# Altium project Business_Idea_PCB.PrjPcb
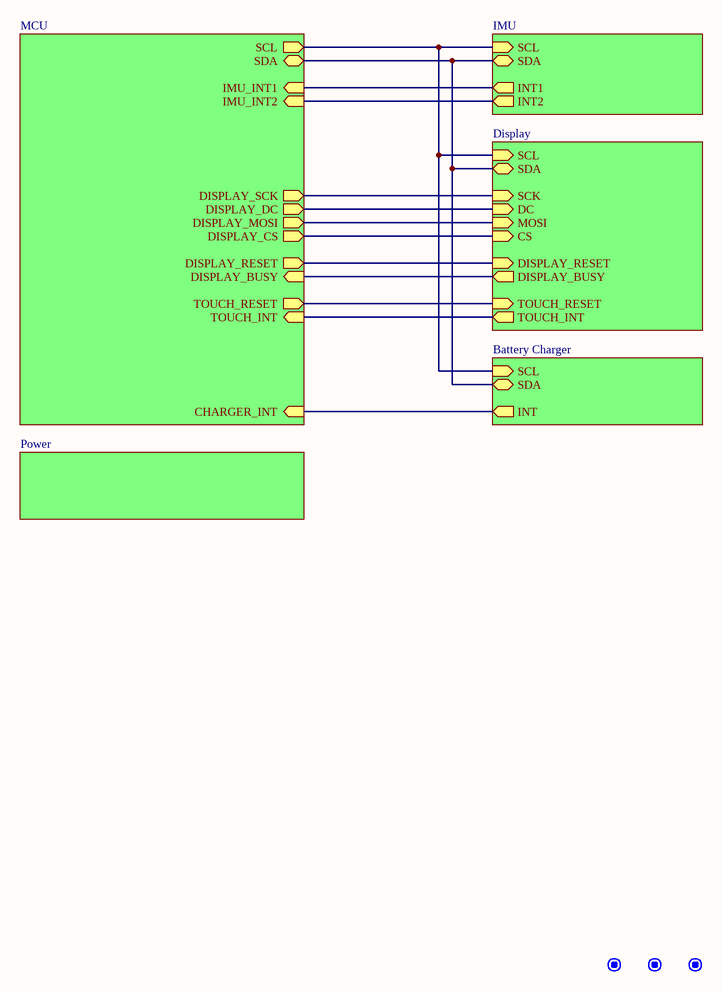
[diagram p0: Root.SchDoc]
ProjectTitle: Business Idea PCB
6 sheets, 51 parts. Net scope: hierarchical (ports join the sheet entries above them; power ports are global).
Board file: Business_Idea_PCB.PcbDoc
Sheets:
  Root.SchDoc
    MCU = MCU.SchDoc
    IMU = IMU.SchDoc
    Display = Display.SchDoc
    Battery Charger = Battery_Charger.SchDoc
    Power = Power.SchDoc

## Sheet Root.SchDoc: Business Idea PCB Root
size Tabloid; Author: Adam Turaj; SheetNumber: 1; SheetTotal: 6

### Parts
FD1  FID1X2R  [FID1X2R]  (value not drawn)  (no BOM)
FD2  FID1X2R  [FID1X2R]  (value not drawn)  (no BOM)
FD3  FID1X2R  [FID1X2R]  (value not drawn)  (no BOM)

### Sub-sheets
Battery Charger = Battery_Charger.SchDoc: SDA (bidir), SCL (in), INT (out)
Display = Display.SchDoc: SCL (in), SDA (bidir), SCK (in), DC (in), CS (in), MOSI (in), DISPLAY_BUSY (out), DISPLAY_RESET (in), TOUCH_INT (out), TOUCH_RESET (in)
IMU = IMU.SchDoc: INT2 (out), INT1 (out), SDA (bidir), SCL (in)
MCU = MCU.SchDoc: SCL (out), SDA (bidir), IMU_INT2 (in), IMU_INT1 (in), CHARGER_INT (in), TOUCH_INT (in), TOUCH_RESET (out), DISPLAY_BUSY (in), DISPLAY_RESET (out), DISPLAY_CS (out), DISPLAY_MOSI (out), DISPLAY_DC (out), DISPLAY_SCK (out)
Power = Power.SchDoc: no entries

### Nets
CHARGER_INT: sheet MCU/CHARGER_INT, sheet Battery Charger/INT
DISPLAY_BUSY: sheet MCU/DISPLAY_BUSY, sheet Display/DISPLAY_BUSY
DISPLAY_CS: sheet MCU/DISPLAY_CS, sheet Display/CS
DISPLAY_DC: sheet MCU/DISPLAY_DC, sheet Display/DC
DISPLAY_MOSI: sheet MCU/DISPLAY_MOSI, sheet Display/MOSI
DISPLAY_RESET: sheet MCU/DISPLAY_RESET, sheet Display/DISPLAY_RESET
DISPLAY_SCK: sheet MCU/DISPLAY_SCK, sheet Display/SCK
IMU_INT1: sheet MCU/IMU_INT1, sheet IMU/INT1
IMU_INT2: sheet MCU/IMU_INT2, sheet IMU/INT2
SCL: sheet MCU/SCL, sheet IMU/SCL, sheet Display/SCL, sheet Battery Charger/SCL
SDA: sheet MCU/SDA, sheet IMU/SDA, sheet Display/SDA, sheet Battery Charger/SDA
TOUCH_INT: sheet MCU/TOUCH_INT, sheet Display/TOUCH_INT
TOUCH_RESET: sheet MCU/TOUCH_RESET, sheet Display/TOUCH_RESET

### Notes on the sheet
- Title:
- Author:
- Size:
- Date:
- Git Hash:
- Tabloid
- Prj:
- Variant:
- Edited:
- File:

### Library data of the parts
FD1-FD3 = CMP-00028-00005-2: Fiducial - Round 1x2mm; Pins: 0

## Sheet MCU.SchDoc: MCU
size Tabloid; Author: Adam Turaj; SheetNumber: 3; SheetTotal: 6
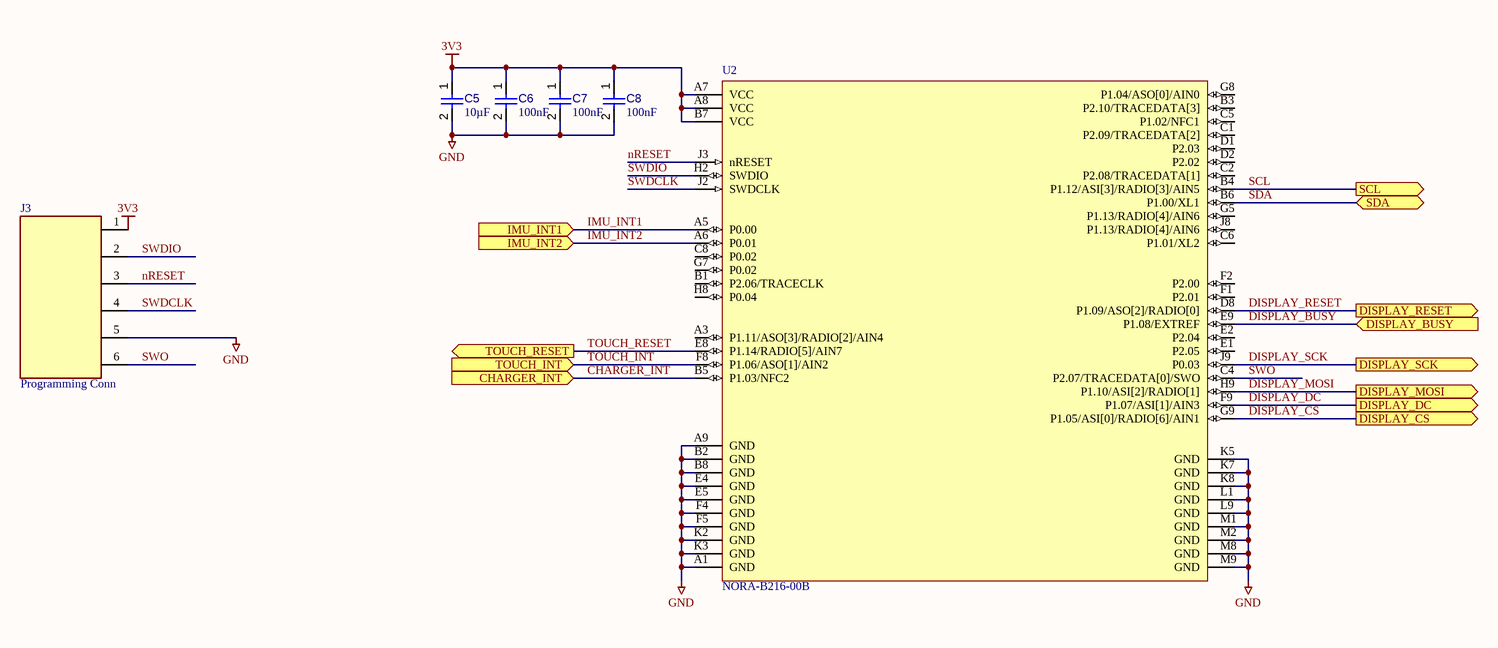
[diagram p1: MCU.SchDoc]

### Parts
C5  value 10µF  [CAPC0603(1608)100_L]  (hidden comment: Capacitor 10µF +/-20% 10V 0603)
C6  value 100nF  [CAPC1608X90X40NL10T20]  (hidden comment: Capacitor 100 nF +/-10% 50 V 0603)
C7  value 100nF  [CAPC1608X90X40NL10T20]  (hidden comment: Capacitor 100 nF +/-10% 50 V 0603)
C8  value 100nF  [CAPC1608X90X40NL10T20]  (hidden comment: Capacitor 100 nF +/-10% 50 V 0603)
J3  Programming Conn  [prog-connector-Footprint-1]
U2  NORA-B216-00B  [NORAB21600B]

### Ports
CHARGER_INT (in, see Root[3C]), DISPLAY_BUSY (in, see Root[3B], Display[3B]), DISPLAY_CS (out, see Root[3B]), DISPLAY_DC (out, see Root[3B]), DISPLAY_MOSI (out, see Root[3B]), DISPLAY_RESET (out, see Root[3B], Display[3B]), DISPLAY_SCK (out, see Root[3B]), IMU_INT1 (in, see Root[3B]), IMU_INT2 (in, see Root[3B]), SCL (out, see Root[3B], Battery_Charger[2C], Display[4B], IMU[4B]), SDA (bidir, see Root[3B], Battery_Charger[2C], Display[4B], IMU[4B]), TOUCH_INT (in, see Root[3C], Display[4B]), TOUCH_RESET (out, see Root[3B], Display[4B])

### Nets
3V3: C5.1 C6.1 C7.1 C8.1 J3.1 U2.A7(VCC) U2.A8(VCC) U2.B7(VCC)
GND: C5.2 C6.2 C7.2 C8.2 J3.5 U2.A1(GND) U2.A9(GND) U2.B2(GND) U2.B8(GND) U2.E4(GND) U2.E5(GND) U2.F4(GND) U2.F5(GND) U2.K2(GND) U2.K3(GND) U2.K5(GND) U2.K7(GND) U2.K8(GND) U2.L1(GND) U2.L9(GND) U2.M1(GND) U2.M2(GND) U2.M8(GND) U2.M9(GND)
CHARGER_INT: U2.B5(P1.03/NFC2) ; port CHARGER_INT
DISPLAY_BUSY: U2.E9(P1.08/EXTREF) ; port DISPLAY_BUSY
DISPLAY_CS: U2.G9(P1.05/ASI[0]/RADIO[6]/AIN1) ; port DISPLAY_CS
DISPLAY_DC: U2.F9(P1.07/ASI[1]/AIN3) ; port DISPLAY_DC
DISPLAY_MOSI: U2.H9(P1.10/ASI[2]/RADIO[1]) ; port DISPLAY_MOSI
DISPLAY_RESET: U2.D8(P1.09/ASO[2]/RADIO[0]) ; port DISPLAY_RESET
DISPLAY_SCK: U2.J9(P0.03) ; port DISPLAY_SCK
IMU_INT1: U2.A5(P0.00) ; port IMU_INT1
IMU_INT2: U2.A6(P0.01) ; port IMU_INT2
nRESET: J3.3 U2.J3(nRESET)
SCL: U2.B4(P1.12/ASI[3]/RADIO[3]/AIN5) ; port SCL
SDA: U2.B6(P1.00/XL1) ; port SDA
SWDCLK: J3.4 U2.J2(SWDCLK)
SWDIO: J3.2 U2.H2(SWDIO)
SWO: J3.6 U2.C4(P2.07/TRACEDATA[0]/SWO)
TOUCH_INT: U2.F8(P1.06/ASO[1]/AIN2) ; port TOUCH_INT
TOUCH_RESET: U2.E8(P1.14/RADIO[5]/AIN7) ; port TOUCH_RESET

Not connected (* = marked no-connect by the designer): U2 A2(NC) A3(P1.11/ASO[3]/RADIO[2]/AIN4) A4(NC) B1(P2.06/TRACECLK) B3(P2.10/TRACEDATA[3]) B9(NC) C1(P2.09/TRACEDATA[2]) C2(P2.08/TRACEDATA[1]) C5(P1.02/NFC1) C6(P1.01/XL2) C8(P0.02) C9(NC) D1(P2.03) D2(P2.02) D3(NC) D7(NC) D9(NC) E1(P2.05) E2(P2.04) E3(NC) E7(NC) F1(P2.01) F2(P2.00) F3(NC) F7(NC) G1(NC) G2(NC) G3(NC) G4(NC) G5(P1.13/RADIO[4]/AIN6) G7(P0.02) G8(P1.04/ASO[0]/AIN0) H1(NC) H3(NC) H7(NC) H8(P0.04) J1(NC) J4(NC) J5(NC) J7(NC) J8(P1.13/RADIO[4]/AIN6) K1(NC) K9(NC)

### Notes on the sheet
- Title:
- Author:
- Size:
- Date:
- Git Hash:
- Tabloid
- Prj:
- Variant:
- Edited:
- File:

### Library data of the parts
C5 = CMP-001-00075-4: Chip Capacitor, 10µF +/-20%, 10V, 0603, Thickness 1 mm; Tolerance: 10%; Voltage Rating: 10V; Max Operating Temperature: 85°C; Pins: 2; Case/Package: 0603; Mounting Technology: SMT; Min Operating Temperature: -55°C
C6-C8 = CMP-001-00017-6: Chip Capacitor, 100 nF, +/- 10%, 50 V, 0603 (1608 Metric); Voltage Rating: 50V; Capacitor Type: Ceramic; Tolerance: 10%; Mounting Technology: SM; Max Operating Temperature: 125°C; RoHS Compliant: True; Pins: 2; Case/Package: 0603; Min Operating Temperature: -55°C
J3 = CMP-002-00075-2: Custom TC2030-NL based connector for programming
U2 = CMP-403-000000-3: Bluetooth Modules - 802.15.1 Bluetooth LE module, (open CPU), pcb antenna, nRF54L10 chip; Manufacturer_Name: u-blox; Geometry.Height: 2mm; Arrow Price/Stock: https://www.arrow.com/en/products/nora-b216-00b/u-blox.html?utm_currency=USD&region=nac; Arrow Part Number: NORA-B216-00B; Manufacturer_Part_Number: NORA-B216-00B; Mouser Price/Stock: *; Design Item ID: NORA-B216-00B; Mouser Part Number: *; Source: NORA-B216-00B.SchLib; Datasheet Link: https://content.u-blox.com/sites/default/files/documents/NORA-B2_DataSheet_UBXDOC-1023859458-38975.pdf

## Sheet IMU.SchDoc: IMU
size Tabloid; Author: Adam Turaj; SheetNumber: 5; SheetTotal: 6
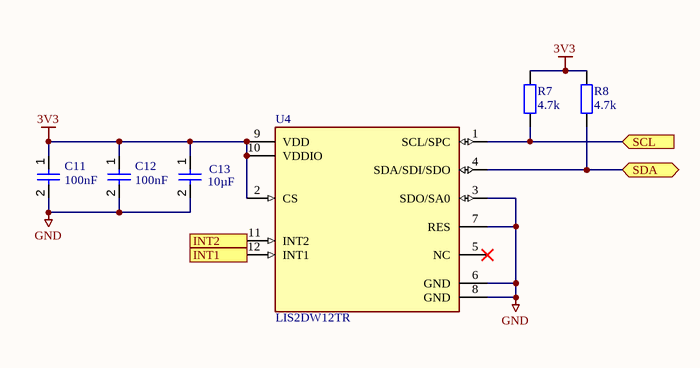
[diagram p2: IMU.SchDoc]

### Parts
C11  100nF  [CAPC1608X90X40NL10T20]
C12  100nF  [CAPC1608X90X40NL10T20]
C13  10µF  [CAPC0603(1608)100_L]
R7  4.7k  [RESC1608X55X25ML10T15]
R8  4.7k  [RESC1608X55X25ML10T15]
U4  LIS2DW12TR  [FP-LGA12-DM00170568-MFG]

### Ports
INT1 (out, see Root[4B]), INT2 (out, see Root[4B]), SCL (in, see Root[4B], Battery_Charger[3C], Display[4B], MCU[5B]), SDA (bidir, see Root[4B], Battery_Charger[3C], Display[4B], MCU[5B])

### Nets
3V3: C11.1 C12.1 C13.1 R7.2 R8.2 U4.2(CS) U4.9(VDD) U4.10(VDDIO)
GND: C11.2 C12.2 C13.2 U4.3(SDO/SA0) U4.6(GND) U4.7(RES) U4.8(GND)
IMU_INT1: U4.12(INT1) ; port INT1
IMU_INT2: U4.11(INT2) ; port INT2
SCL: R7.1 U4.1(SCL/SPC) ; port SCL
SDA: R8.1 U4.4(SDA/SDI/SDO) ; port SDA

Not connected (* = marked no-connect by the designer): U4 5(NC)*

### Notes on the sheet
- Title:
- Author:
- Size:
- Date:
- Git Hash:
- Tabloid
- Prj:
- Variant:
- Edited:
- File:

### Library data of the parts
C11 C12 = CMP-001-00017-6: as C6 on sheet MCU; Tolerance: 10%; Mounting Technology: SM; Value: 100nF; Max Operating Temperature: 125°C; RoHS Compliant: True; Pins: 2; Case/Package: 0603; Min Operating Temperature: -55°C
C13 = CMP-001-00075-4: as C5 on sheet MCU; Voltage Rating: 10V; Max Operating Temperature: 85°C; Pins: 2; Case/Package: 0603; Mounting Technology: SMT; Min Operating Temperature: -55°C; Value: 10µF
R7 R8 = CMP-009-00031-5: Chip Resistor, 4.7 KOhm, +/- 1%, 0.1 W, -55 to 155 degC, 0603 (1608 Metric); Power: 100mW; Tolerance: 1%; Mounting Technology: SM; Case/Package: 0603; Value: 4.7k; RoHS Compliant: True; Pins: 2; Min Operating Temperature: -55°C; Max Operating Temperature: 155°C
U4 = CMP-12175-000006-1: ACCEL 2-16G I2C/SPI 12LGA; Manufacturer: STMicroelectronics; Min Supply Voltage: 1.62V; Operating Supply Current: 0.38-90uA; Sensor Output: I2C,SPI; Accel Resolution: 14bits; Max Supply Voltage: 3.6V; Accel Range: 2/4/8/16g; Height: 0.7mm; Device Class L1: Sensors; RoHS: TRUE; Temperature Range Low: -40°C; Category: IC; Mouser Description: Accelerometer Triple ±2g/±4g/±8g/±16g 1.62V to 3.6V 0.244mg/digit/0.488mg/digit/0.976mg/digit/1.952mg/digit 12-Pin LG...; Digikey Description: ACCEL 2-16G I2C/SPI 12LGA; ComponentLink2URL: https://www.st.com/resource/en/datasheet/lis2dw12.pdf; Automotive: No; Manufacturer Part Number: LIS2DW12TR; Lead Free: Yes; Footprint Url: https://www.st.com/content/ccc/resource/technical/document/technical_note/73/17/9c/16/dd/96/4a/01/CD00134799.pdf/files/CD00134799.pdf/jcr:content/translations/en.CD00134799.pdf; Temperature: -40°C to +85°C; Device Class L3: Accelerometers; Package: LGA12-DM00170568; Temperature Range High: +85°C; Device Class L2: Motion Sensors; Octopart: https://octopart.com/lis2dw12tr-stmicroelectronics-77080925; ComponentLink2Description: Datasheet

## Sheet Display.SchDoc: Display
size Tabloid; Author: Adam Turaj; SheetNumber: 6; SheetTotal: 6
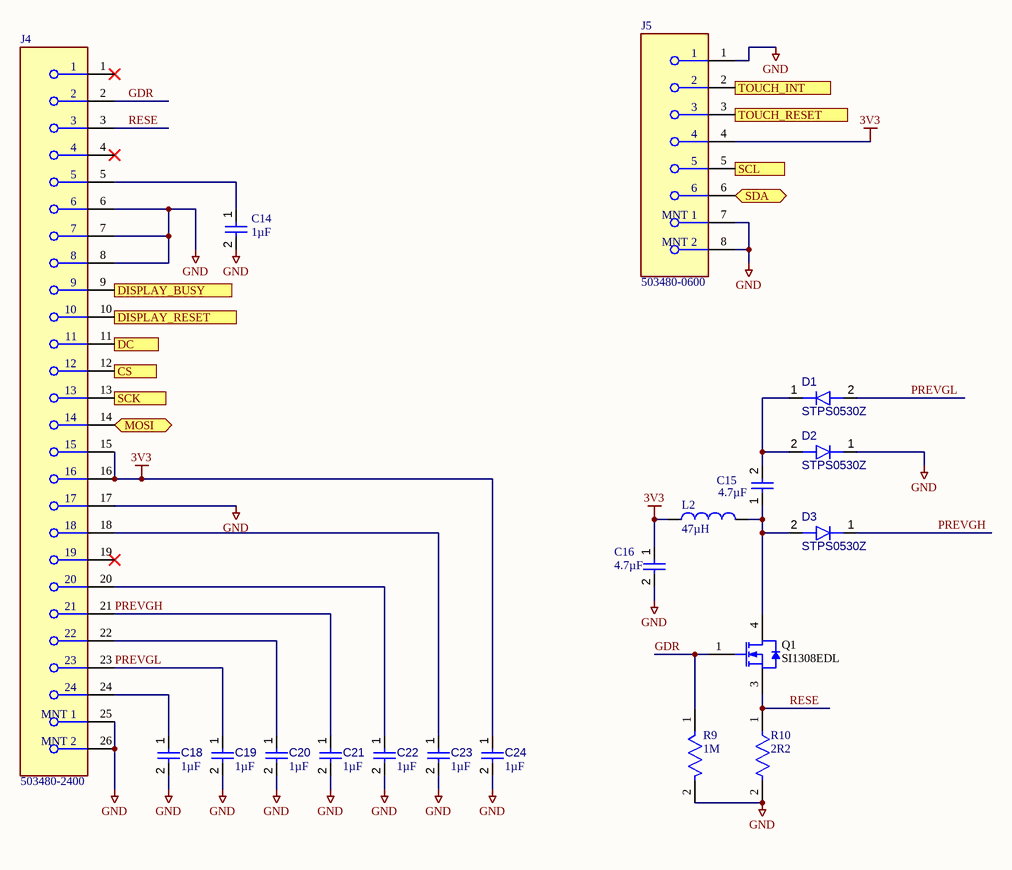
[diagram p3: Display.SchDoc]

### Parts
C14  1µF  [CAPC1608X90X40LL10T20]
C15  4.7µF  [CAPC0603(1608)100_L]
C16  4.7µF  [CAPC0603(1608)100_L]
C18  value 1µF  [CAPC0603(1608)100_L]  (hidden comment: Capacitor 1µF +/-0.1% 25V 0603)
C19  value 1µF  [CAPC0603(1608)100_L]  (hidden comment: Capacitor 1µF +/-0.1% 25V 0603)
C20  value 1µF  [CAPC0603(1608)100_L]  (hidden comment: Capacitor 1µF +/-0.1% 25V 0603)
C21  value 1µF  [CAPC0603(1608)100_L]  (hidden comment: Capacitor 1µF +/-0.1% 25V 0603)
C22  value 1µF  [CAPC0603(1608)100_L]  (hidden comment: Capacitor 1µF +/-0.1% 25V 0603)
C23  value 1µF  [CAPC0603(1608)100_L]  (hidden comment: Capacitor 1µF +/-0.1% 25V 0603)
C24  value 1µF  [CAPC0603(1608)100_L]  (hidden comment: Capacitor 1µF +/-0.1% 25V 0603)
D1  STPS0530Z  [MCC-SOD123_V]
D2  STPS0530Z  [MCC-SOD123_V]
D3  STPS0530Z  [MCC-SOD123_V]
J4  503480-2400  [FP-503480-2400-MFG]
J5  503480-0600  [MOLX-503480-0600]
L2  value 47µH  [FP-SDE0403AT-MFG]  (hidden comment: SDE0403AT-470K)
Q1  SI1308EDL  [FP-5549-IPC_A]
R9  1M  [FP-RC0603-0_55-IPC_C]
R10  2R2  [FP-RC0603-0_55-IPC_A]

### Ports
CS (in, see Root[4B]), DC (in, see Root[4B]), DISPLAY_BUSY (out, see Root[4B], MCU[5B]), DISPLAY_RESET (in, see Root[4B], MCU[5B]), MOSI (bidir, see Root[4B]), SCK (in, see Root[4B]), SCL (in, see Root[4B], Battery_Charger[2C], IMU[4B], MCU[5B]), SDA (bidir, see Root[4B], Battery_Charger[2C], IMU[4B], MCU[5B]), TOUCH_INT (out, see Root[4C], MCU[3C]), TOUCH_RESET (in, see Root[4B], MCU[3C])

### Nets
3V3: C16.1 C24.1 J4.15 J4.16 J5.4 L2.1
GND: C14.2 C16.2 C18.2 C19.2 C20.2 C21.2 C22.2 C23.2 C24.2 D2.1(K) J4.6 J4.7 J4.8 J4.17 J4.25(MNT_1) J4.26(MNT_2) J5.1 J5.7(MNT_1) J5.8(MNT_2) R9.2 R10.2
DISPLAY_BUSY: J4.9 ; port DISPLAY_BUSY
DISPLAY_CS: J4.12 ; port CS
DISPLAY_DC: J4.11 ; port DC
DISPLAY_MOSI: J4.14 ; port MOSI
DISPLAY_RESET: J4.10 ; port DISPLAY_RESET
DISPLAY_SCK: J4.13 ; port SCK
GDR: J4.2 Q1.1(G) R9.1
PREVGH: C21.1 D3.1(K) J4.21
PREVGL: C19.1 D1.2(A) J4.23
RESE: J4.3 Q1.3(S) R10.1
SCL: J5.5 ; port SCL
SDA: J5.6 ; port SDA
TOUCH_INT: J5.2 ; port TOUCH_INT
TOUCH_RESET: J5.3 ; port TOUCH_RESET
NetC14_1: C14.1 J4.5
NetC15_1: C15.1 D3.2(A) L2.2 Q1.4(D)
NetC15_2: C15.2 D1.1(K) D2.2(A)
NetC18_1: C18.1 J4.24
NetC20_1: C20.1 J4.22
NetC22_1: C22.1 J4.20
NetC23_1: C23.1 J4.18

Not connected (* = marked no-connect by the designer): J4 1* 4* 19*

### Notes on the sheet
- Title:
- Author:
- Size:
- Date:
- Git Hash:
- Tabloid
- Prj:
- Variant:
- Edited:
- File:

### Library data of the parts
C14 = CMP-001-00005-6: Chip Capacitor, 1 uF, +/- 10%, 25 V, 0603 (1608 Metric); Capacitor Type: Ceramic; Voltage Rating: 25V; Pins: 2; Value: 1µF; Mounting Technology: SM; RoHS Compliant: True; Max Operating Temperature: 125°C; Case/Package: 0603; Min Operating Temperature: -55°C; Tolerance: 10%
C15 = CMP-001-00076-4: Chip Capacitor, 4.7µF +/-20%, 25V, 0603, Thickness 1 mm; Tolerance: 10%; Mounting Technology: SMT; Case/Package: 0603; Pins: 2; Min Operating Temperature: -55°C; Max Operating Temperature: 85°C; Value: 4.7µF; Voltage Rating: 25V
C16 = CMP-001-00076-4: Chip Capacitor, 4.7µF +/-20%, 10V, 0603, Thickness 1 mm; Tolerance: 10%; Mounting Technology: SMT; Case/Package: 0603; Pins: 2; Min Operating Temperature: -55°C; Max Operating Temperature: 85°C; Value: 4.7µF; Voltage Rating: 10V
C18-C24 = CMP-001-00055-4: Chip Capacitor, 1µF +/-0.1%, 25V, 0603, Thickness 1 mm; Tolerance: 20%; Min Operating Temperature: -55°C; Max Operating Temperature: 85°C; Voltage Rating: 25V; Mounting Technology: SMT; Case/Package: 0603; Pins: 2
D1-D3 = CMP-004-00031-1: SCHOTTKY RECTIFIER Rectifier Diode, Schottky, 1 Phase, 1 Element, 0.5A, 30V V(RRM), Silicon; Forward Current: 500mA; Max Surge Current: 5.5A; Forward Voltage: 220mV; Min Operating Temperature: -40°C; Mounting Technology: Surface Mount; Pins: 2; Max Operating Temperature: 150°C
J4 = CMP-002-00076-1: Molex 503480-2400 FFC & FPC Connectors, 0.5mm, FPC Ra Smt Dual Cont 24 Circuit,; Voltage Rating: 50V; Gender: Female; Max Operating Temperature: 105°C; Min Operating Temperature: -40°C; Mounting Technology: Surface Mount; Pins: 24
J5 = CMP-002-00077-1: FFC and FPC Connectors; MOLEX; 503480-0600; Gold; Surface Mount; 500 mA; 6; Voltage Rating: 50V; Gender: Female; Max Operating Temperature: 105°C; Mounting Technology: Surface Mount; Min Operating Temperature: -40°C; Pins: 6
L2 = CMP-006-00026-2: Inductor Power Unshielded Wirewound 47uH 10% 1MHz Ferrite 0.5A 0.631Ohm DCR Automotive AEC-Q200; Max Current Rating: 500mA; Self Resonant Frequency: 16MHz; Case/Package: 1816; Tolerance: 10%; Min Operating Temperature: -55°C; Max Operating Temperature: 150°C
Q1 = CMP-013-00034-1: SI1308EDL-T1-GE3 N-channel Mosfet Transistor, 1.5 A, 30 V, 3-PIN SC-70; Case/Package: SOT-323; Mounting Technology: Surface Mount; Min Operating Temperature: -55°C; Pins: 3; Max Operating Temperature: 150°C
R9 = CMP-2000-06953-2: RES SMD 1M OHM 5% 1/10W 0603; Voltage Rating (DC): 50V; Power Rating: 100mW; Temperature Coefficient: 100ppm/°C; Resistance: 1MR; Features: Moisture Resistant; Package Quantity: 5000; Case Code (Imperial): 0603; Packaging: Tape and Reel; Resistor Type: Thick Film; Number of Pins: 2; Size Code: 0603; Resistance Tolerance: 5%; Max Operating Temperature: 155°C; Voltage Rating: 50V; Depth: 0.8mm; Termination: SMD/SMT; Width: 0.8mm; RoHS Compliant: Yes; Number of Terminations: 2; Height: 0.45mm; Lead Free: Lead Free; Case/Package: 0603; Military Standard: Not; Min Operating Temperature: -55°C; Case Code (Metric): 1608; Radiation Hardening: No; Series: RC; Length: 1.6mm; Tolerance: 5%; REACH SVHC: No SVHC; Contact Plating: Tin; Construction: Rectangular; Max Power Dissipation: 100mW
R10 = CMP-03412-037810-1: RES SMD 2.2 OHM 1% 1/10W 0603; Voltage Rating: 50V; Max Power Dissipation: 100mW; Resistance: 2.2R; Temperature Coefficient: 200ppm/°C; Lead Free: Lead Free; Series: RC; Resistor Type: Thick Film; Case Code (Imperial): 0603; Number of Pins: 2; Min Operating Temperature: -55°C; Packaging: Tape and Reel; Length: 0.063inch; Power Rating: 100mW; Features: Moisture Resistant; Resistance Tolerance: 1%; Termination: SMD/SMT; Width: 0.031inch; REACH SVHC: No SVHC; Case Code (Metric): 1608; Height: 0.022inch; Voltage Rating (DC): 50V; Size Code: 0603; Max Operating Temperature: 155°C; Case/Package: 0603; Number of Terminations: 2; Depth: 0.8mm; Tolerance: 1%; RoHS Compliant: Yes; Technology: THICK FILM; Package Quantity: 1

## Sheet Battery_Charger.SchDoc: Battery Charger
size Tabloid; Author: Adam Turaj; SheetNumber: 2; SheetTotal: 6
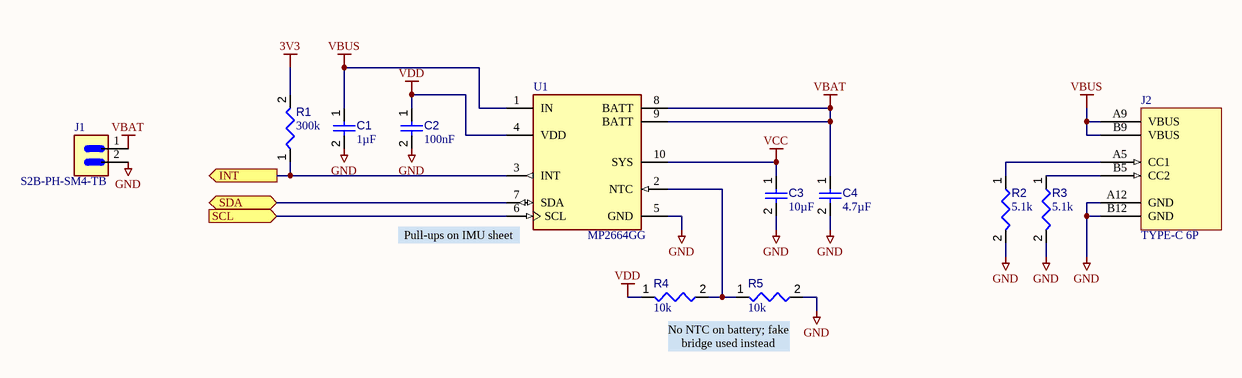
[diagram p4: Battery_Charger.SchDoc]

### Parts
C1  value 1µF  [CAPC0603(1608)100_L]  (hidden comment: Capacitor 1µF +/-40% 50V 0603)
C2  value 100nF  [CAPC1608X90X40NL10T20]  (hidden comment: Capacitor 100 nF +/-10% 50 V 0603)
C3  value 10µF  [CAPC0603(1608)100_L]  (hidden comment: Capacitor 10µF +/-20% 10V 0603)
C4  value 4.7µF  [CAPC0603(1608)100_L]  (hidden comment: Capacitor 4.7µF +/-20% 10V 0603)
J1  S2B-PH-SM4-TB  [JST_S2B-PH-SM4-TB]
J2  TYPE-C 6P  [TYPE-C 8P-Footprint-1]
R1  value 300k  [RESC1608X55X25ML10T15]  (hidden comment: Resistor 300k +/-1% 0603 100 mW)
R2  value 5.1k  [RESC1608X55X25ML10T15]  (hidden comment: Resistor 5k1 +/-1% 0603 100 mW)
R3  value 5.1k  [RESC1608X55X25ML10T15]  (hidden comment: Resistor 5k1 +/-1% 0603 100 mW)
R4  value 10k  [RESC1608X55X25ML10T15]  (hidden comment: Resistor 10k +/-1% 0603 100 mW)
R5  value 10k  [RESC1608X55X25ML10T15]  (hidden comment: Resistor 10k +/-1% 0603 100 mW)
U1  MP2664GG  [QFN50P200X200X100-10N]

### Ports
INT (out, see Root[4C]), SCL (in, see Root[4C], Display[4B], IMU[4B], MCU[5B]), SDA (bidir, see Root[4C], Display[4B], IMU[4B], MCU[5B])

### Nets
3V3: R1.2
GND: C1.2 C2.2 C3.2 C4.2 J1.2 J2.A12(GND) J2.B12(GND) R2.2 R3.2 R5.2 U1.5(GND)
VBAT: C4.1 J1.1 U1.8(BATT) U1.9(BATT)
VBUS: C1.1 J2.A9(VBUS) J2.B9(VBUS) U1.1(IN)
VCC: C3.1 U1.10(SYS)
VDD: C2.1 R4.1 U1.4(VDD)
CHARGER_INT: R1.1 U1.3(INT) ; port INT
SCL: U1.6(SCL) ; port SCL
SDA: U1.7(SDA) ; port SDA
NetJ2_A5: J2.A5(CC1) R2.1
NetJ2_B5: J2.B5(CC2) R3.1
NetR4_2: R4.2 R5.1 U1.2(NTC)

### Notes on the sheet
- (near U1) Pull-ups on IMU sheet
- No NTC on battery; fake bridge used instead
- Title:
- Author:
- Size:
- Date:
- Git Hash:
- Tabloid
- Prj:
- Variant:
- Edited:
- File:

### Library data of the parts
C1 = CMP-001-00078-4: Chip Capacitor, 1µF +/-40%, 50V, 0603, Thickness 1 mm; Tolerance: 10%; Case/Package: 0603; Pins: 2; Max Operating Temperature: 85°C; Voltage Rating: 50V; Mounting Technology: SMT; Min Operating Temperature: -55°C
C2 = CMP-001-00017-6: as C6 on sheet MCU; Tolerance: 10%; Mounting Technology: SM; Max Operating Temperature: 125°C; RoHS Compliant: True; Pins: 2; Case/Package: 0603; Min Operating Temperature: -55°C
C3 = CMP-001-00075-4: as C5 on sheet MCU; Voltage Rating: 10V; Max Operating Temperature: 85°C; Pins: 2; Case/Package: 0603; Mounting Technology: SMT; Min Operating Temperature: -55°C
C4 = CMP-001-00076-4: as C16 on sheet Display; Mounting Technology: SMT; Case/Package: 0603; Pins: 2; Min Operating Temperature: -55°C; Max Operating Temperature: 85°C; Voltage Rating: 10V
J1 = CMP-002-00072-3: Connector Header Surface Mount, Right Angle 2 position 0.079 (2.00mm); MF: JST Sales; Check_prices: https://www.snapeda.com/parts/S2B-PH-SM4-TB/JST/view-part/?ref=eda; Design Item ID: S2B-PH-SM4-TB; MP: S2B-PH-SM4-TB; Value: *; Case/Package: None; Source: S2B-PH-SM4-TB.SchLib; Component Type: Standard; Pins: 2; SnapEDA_Link: https://www.snapeda.com/parts/S2B-PH-SM4-TB/JST/view-part/?ref=snap
J2 = CMP-002-00074-2: 6P Black Female Surface Mount, Right Angle USB Type-C; Max Current Rating: 3A; Voltage Rating: 5V; Max Operating Temperature: 80°C; Mounting Technology: Right Angle; Pins: 6; Connector Type: USB; Case/Package: SMD; Gender: Female; Min Operating Temperature: -30°C
R1 = CMP-009-00178-1: Chip Resistor, 300 KOhm, +/- 1%, 0.1 W, -55 to 155 degC, 0603 (1608 Metric); Voltage Rating: 50V; Power: 100mW; Mounting Technology: SM; Tolerance: 1%; Max Operating Temperature: 155°C; RoHS Compliant: True; Pins: 2; Case/Package: 0603; Min Operating Temperature: -55°C
R2 R3 = CMP-009-00183-1: Chip Resistor, 5.1 KOhm, +/- 1%, 0.1 W, -55 to 155 degC, 0603 (1608 Metric); Power: 100mW; Voltage Rating: 50V; Min Operating Temperature: -55°C; Pins: 2; Tolerance: 1%; Case/Package: 0603; RoHS Compliant: True; Max Operating Temperature: 155°C; Mounting Technology: SM
R4 R5 = CMP-009-00017-5: Chip Resistor, 10 KOhm, +/- 1%, 01 W, -55 to 155 degC, 0603 (1608 Metric); Voltage Rating: 50V; Power: 100mW; RoHS Compliant: True; Min Operating Temperature: -55°C; Pins: 2; Case/Package: 0603; Mounting Technology: SM; Max Operating Temperature: 155°C; Tolerance: 1%
U1 = CMP-00029-00001-2: Battery Management 500mA 5V USB I2C Controlled Battery Charger; MF: Monolithic Power Systems (MPS); Component Type: Standard; SnapEDA_Link: https://www.snapeda.com/parts/MP2664GG-0000-Z/Monolithic+Power+Systems/view-part/?ref=snap; Source: MP2664GG-0000-Z.SchLib; Case/Package: None; Pins: 10; Check_prices: https://www.snapeda.com/parts/MP2664GG-0000-Z/Monolithic+Power+Systems/view-part/?ref=eda; MP: MP2664GG-0000-Z; Design Item ID: MP2664GG-0000-Z; Value: *

## Sheet Power.SchDoc: Power
size Tabloid; Author: Adam Turaj; SheetNumber: 4; SheetTotal: 6
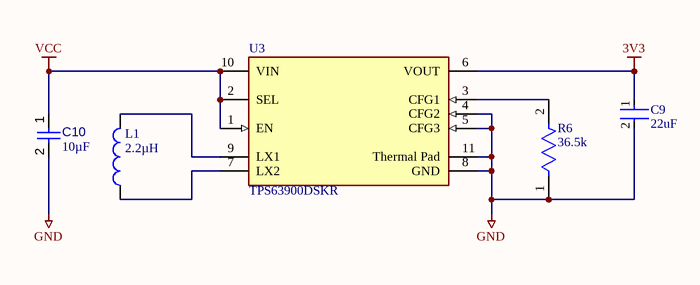
[diagram p5: Power.SchDoc]

### Parts
C9  22uF  [FP-GRM188-0_2-IPC_C]
C10  value 10µF  [CAPC0603(1608)100_L]  (hidden comment: Capacitor 10µF +/-20% 10V 0603)
L1  value 2.2µH  [FP-DFE201210U-MFG]  (hidden comment: DFE201210U-2R2M=P2)
R6  36.5k  [FP-AC0603-IPC_C]
U3  TPS63900DSKR  [FP-DSK0010A-IPC_C]

### Nets
3V3: C9.1 U3.6(VOUT)
GND: C9.2 C10.2 R6.1 U3.4(CFG2) U3.5(CFG3) U3.8(GND) U3.11(Thermal_Pad)
VCC: C10.1 U3.1(EN) U3.2(SEL) U3.10(VIN)
NetL1_1: L1.1 U3.7(LX2)
NetL1_2: L1.2 U3.9(LX1)
NetR6_2: R6.2 U3.3(CFG1)

### Notes on the sheet
- Title:
- Author:
- Size:
- Date:
- Git Hash:
- Tabloid
- Prj:
- Variant:
- Edited:
- File:

### Library data of the parts
C9 = CMP-2000-06337-3: Chip Multilayer Ceramic Capacitors for General Purpose, 0603, 22uF, X5R, 15%, 20%, 10V; Tolerance: 20%; Weight: 0.000222oz; Material: Ceramic; Depth: 0.8mm; Length: 1.6mm; Termination: SMD/SMT; Capacitance: 22uF; Packaging: Tape and Reel; Width: 0.8mm; Voltage Rating: 10V; Case Code (Imperial): 0603; Mount: Surface Mount; Voltage Rating (DC): 10V; Case/Package: 0603; Thickness: 0.039inch; REACH SVHC: No SVHC; Dielectric: X5R; Height: 0.8mm; Package Quantity: 4000; Case Code (Metric): 1608; Min Operating Temperature: -55°C; Lead Free: Lead Free; Max Operating Temperature: 85°C
C10 = CMP-001-00075-4: as C5 on sheet MCU; Voltage Rating: 10V; Max Operating Temperature: 85°C; Pins: 2; Case/Package: 0603; Mounting Technology: SMT; Min Operating Temperature: -55°C
L1 = CMP-006-00025-2: Inductor Power Shielded Wirewound 2.2uH 20% 1MHz Metal 1.2A 0.228Ohm DCR 0805 T/R; Self Resonant Frequency: 80MHz; Min Operating Temperature: -40°C; Mounting Technology: Surface Mount; Current Rating: 1.2A; Max Current Rating: 1.2A; Tolerance: 20%; Max Operating Temperature: 125°C; Case/Package: 0805
R6 = CMP-03412-047799-1: RES 36.5KΩ 0.50% 0.1W 0603; RoHS Compliant: Yes
U3 = CMP-04918-000700-1: 1.8-V TO 5.5-V, 75-NA IQ BUCK-BO; RoHS Compliant: Yes

## Nets that join several sheets
3V3: MCU (8 pins), IMU (8 pins), Display (6 pins), Battery_Charger (R1.2), Power (C9.1 U3.6)
GND: MCU (24 pins), IMU (7 pins), Display (21 pins), Battery_Charger (11 pins), Power (7 pins)
VCC: Battery_Charger (C3.1 U1.10), Power (C10.1 U3.1 U3.2 U3.10)
CHARGER_INT: MCU (U2.B5), Battery_Charger (R1.1 U1.3)
DISPLAY_BUSY: MCU (U2.E9), Display (J4.9)
DISPLAY_CS: MCU (U2.G9), Display (J4.12)
DISPLAY_DC: MCU (U2.F9), Display (J4.11)
DISPLAY_MOSI: MCU (U2.H9), Display (J4.14)
DISPLAY_RESET: MCU (U2.D8), Display (J4.10)
DISPLAY_SCK: MCU (U2.J9), Display (J4.13)
IMU_INT1: MCU (U2.A5), IMU (U4.12)
IMU_INT2: MCU (U2.A6), IMU (U4.11)
SCL: MCU (U2.B4), IMU (R7.1 U4.1), Display (J5.5), Battery_Charger (U1.6)
SDA: MCU (U2.B6), IMU (R8.1 U4.4), Display (J5.6), Battery_Charger (U1.7)
TOUCH_INT: MCU (U2.F8), Display (J5.2)
TOUCH_RESET: MCU (U2.E8), Display (J5.3)